# EAGLE design ex1-sch (EAGLE 9.6.2)
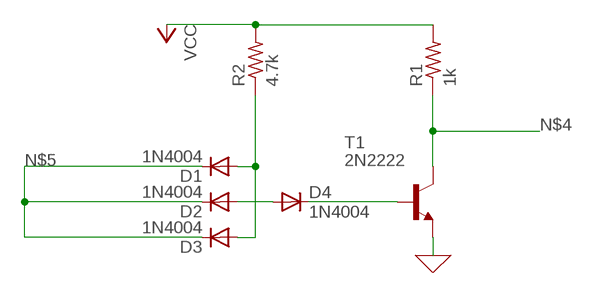
[diagram p0: schematic, sheet 1]

## Parts
D1  1N4004  [DO41-10]
D2  1N4004  [DO41-10]
D3  1N4004  [DO41-10]
D4  1N4004  [DO41-10]
R1  1k  FLIPFLOP-RES  [0805-THM]
R2  4.7k  FLIPFLOP-RES  [0805-THM]
T1  2N2222  [TO92-EBC-OVAL]

## Nets
0: T1.E ; supply symbol labelled GND
N$1: D4.C T1.B
N$2: D1.A D3.A R2.1
N$3: D2.A D4.A
N$4: R1.1 T1.C
N$5: D1.C D2.C D3.C
VCC: R1.2 R2.2

## Library data of the parts
D1-D4 = adafruit:1N4004: DIODE General purpose 1N400x type rectifier (With bigger pads) http://www.ladyada.net/library/pcb/eaglelibrary.html
R1 R2 = adafruit:FLIPFLOP-RES: Flip Flop resistor An 0805 resistor inside a standard 1/4W 5% resistor. Makes for easy mods
T1 = adafruit:2N2222: NPN TRANSISTOR Big oval pads

## Board
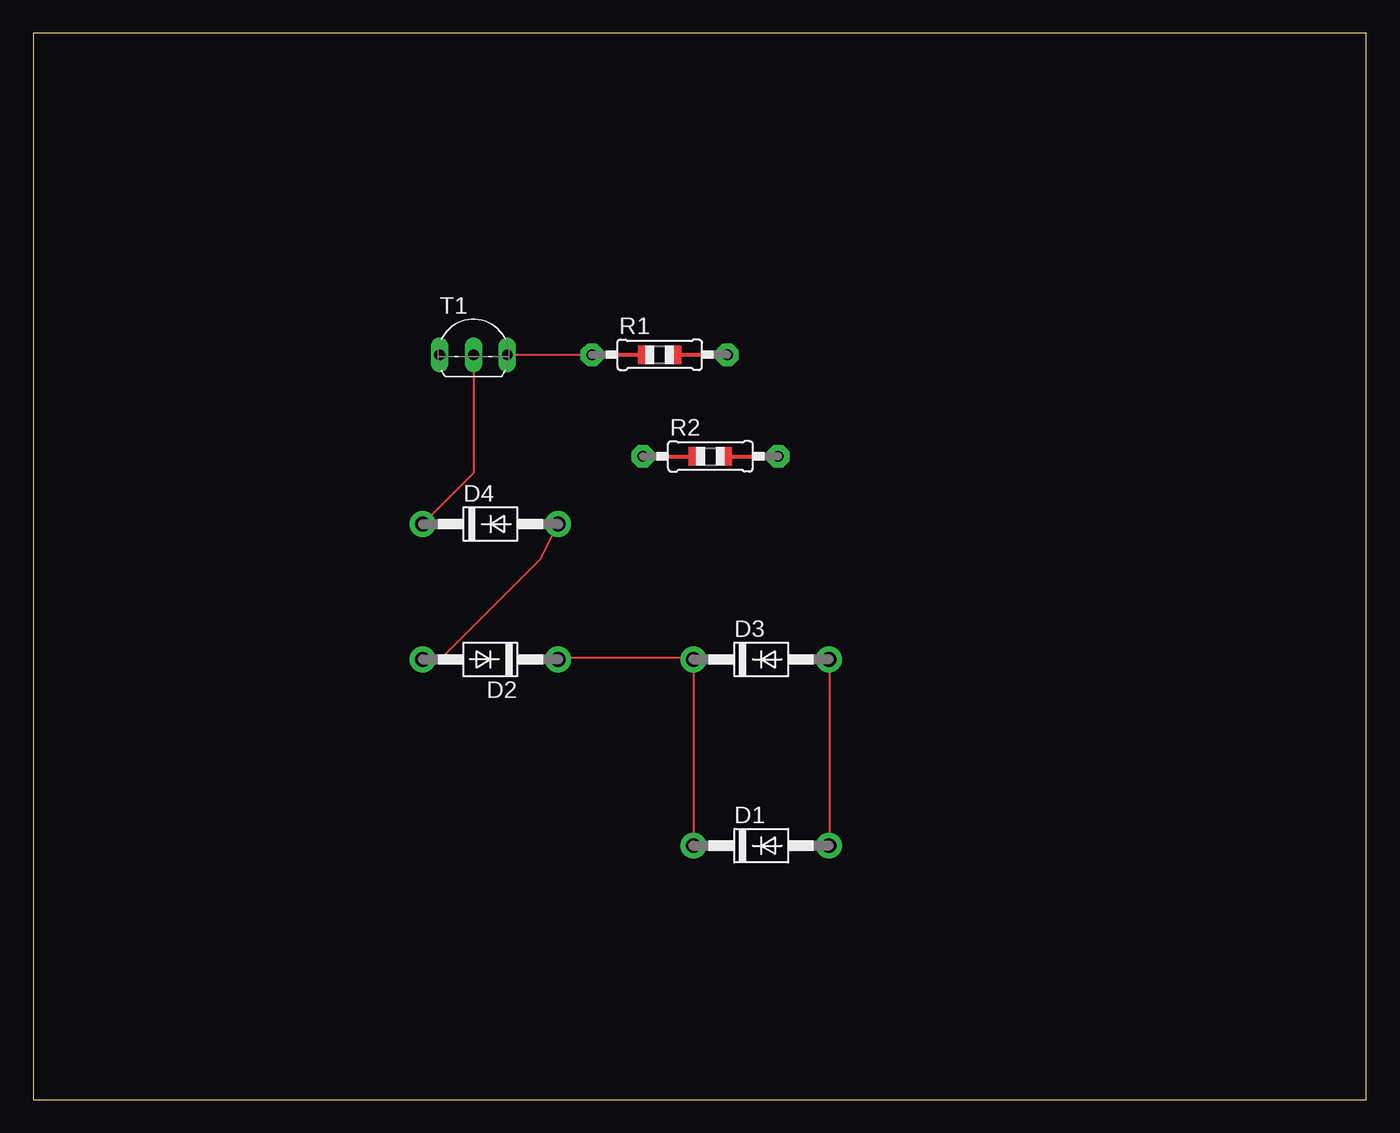
[diagram p1: board, top side]
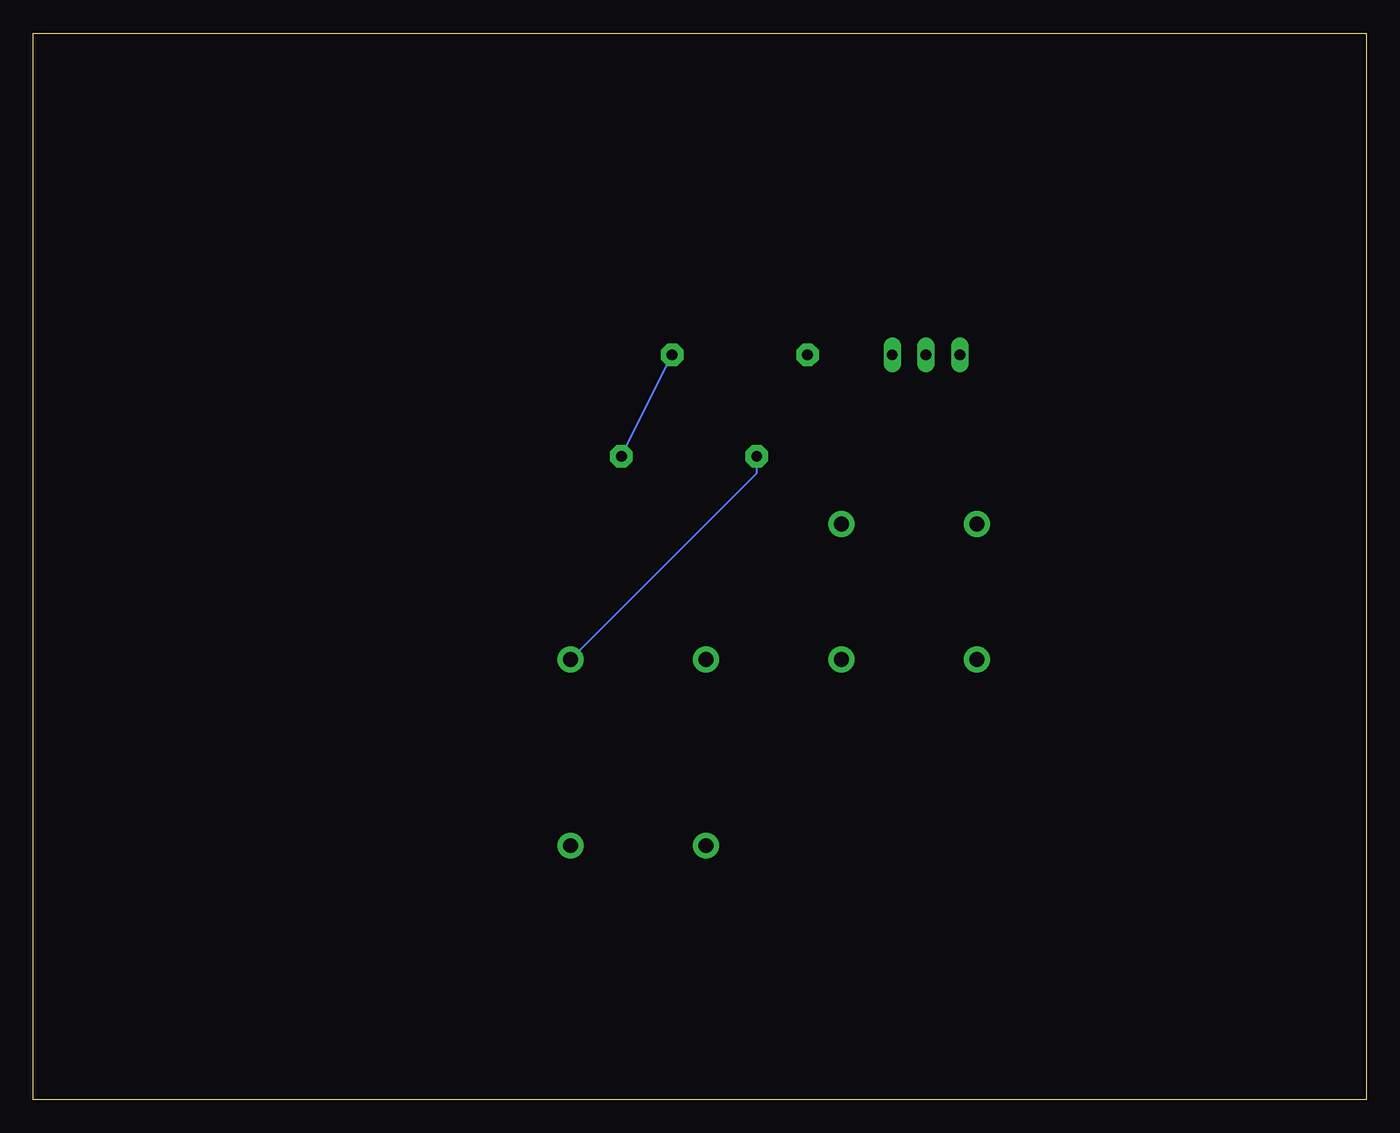
[diagram p2: board, bottom side, seen from below]

Size 100 x 80 mm. Coordinates in mm from the lower left corner, seen from the top.
Outline: 0,0 100,0 100,80 0,80 0,0
Copper layers (1*16): Top 0.035mm / dielectric 1.5mm / Bottom 0.035mm
Design rules "default": minimum track width 6mil, minimum drill 0.35mm, track to track 6mil, track to pad 6mil, pad to pad 6mil, via to via 6mil, smd to smd 6mil, copper to edge 40mil, drill to drill 6mil, minimum pad ring 10mil, minimum via ring 8mil, stop-mask expansion 4mil, vias tented up to drill 0mil, thermal gap 10mil

### Footprints (pad centres in the part's own frame; a part is rotated, then mirrored left to right if it is on the bottom)
DO41-10 = drill 1.118 pad 1.93: A 5.08,0; C -5.08,0
0805-THM = drill 0.813 pad 1.676 octagon: 1 -5.08,0; 2 5.08,0
TO92-EBC-OVAL = drill 0.813 long: B 0,-1.27; C 2.54,-1.27; E -2.54,-1.27

### Placement (x,y rotation side)
D1  54.61,19.05 0 top
D2  34.29,33.02 180 top
D3  54.61,33.02 0 top
D4  34.29,43.18 0 top
R1  46.99,55.88 0 top
R2  50.8,48.26 0 top
T1  33.02,57.15 0 top

### Tracks (layer width: path | path; a pad name or v marks a point on that pad's centre or on a via)
N$1
  Top 0.152: T1.B 33.02,46.99 D4.C
N$2
  Top 0.152: D1.A 59.74,19.1 59.74,32.97 D3.A
  Bottom 0.152: D3.A 45.72,46.99 R2.1
N$3
  Top 0.152: D2.A 29.26,33.12 30.63,33.12 38.05,40.54 D4.A
N$4
  Top 0.152: T1.C R1.1
N$5
  Top 0.152: D2.C 39.47,33.12 49.53,33.12 D3.C D1.C
VCC
  Bottom 0.152: R2.2 55.95,48.27 55.83,48.36 R1.2